# Altium schematic sheet A3x4.SchDoc: Название платы
size 1188 x 420 mm; ApprovedBy: Рогов; CheckedBy: Фамилия проверяющего; DrawnBy: Фамилия разработчика; DocumentNumber: Введите номер платы + Э3; SheetNumber: пусто если листов 1, иначе 1; SheetTotal: количество листов; Format: A3x4; DocumentType: тип схемы; Title1str: вторая строка при необходимости; ImagePath: Введите номер платы
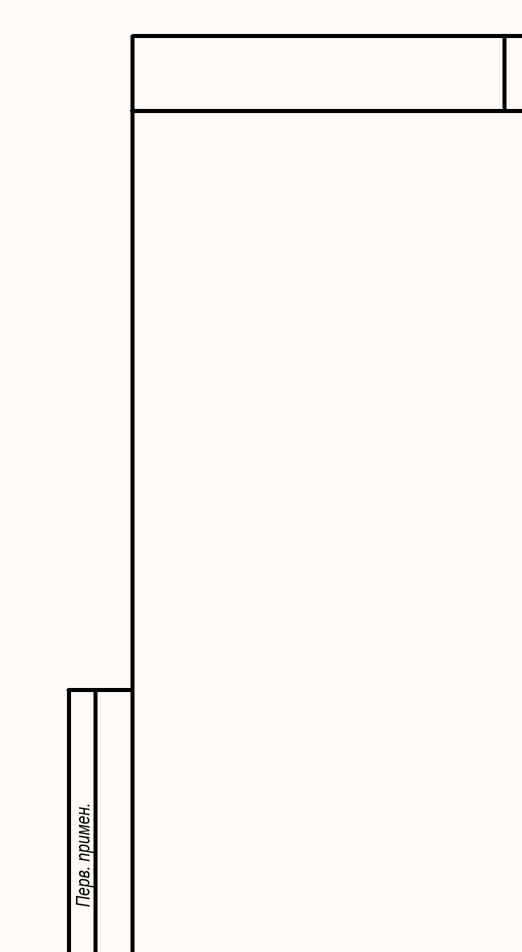
[diagram p0: A3x4.SchDoc, top column 1 of 4]
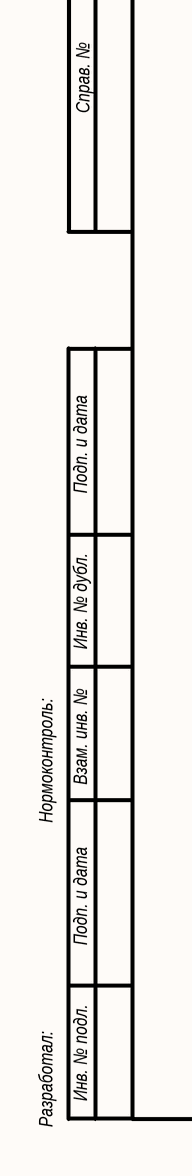
[diagram p1: A3x4.SchDoc, bottom column 1 of 4]
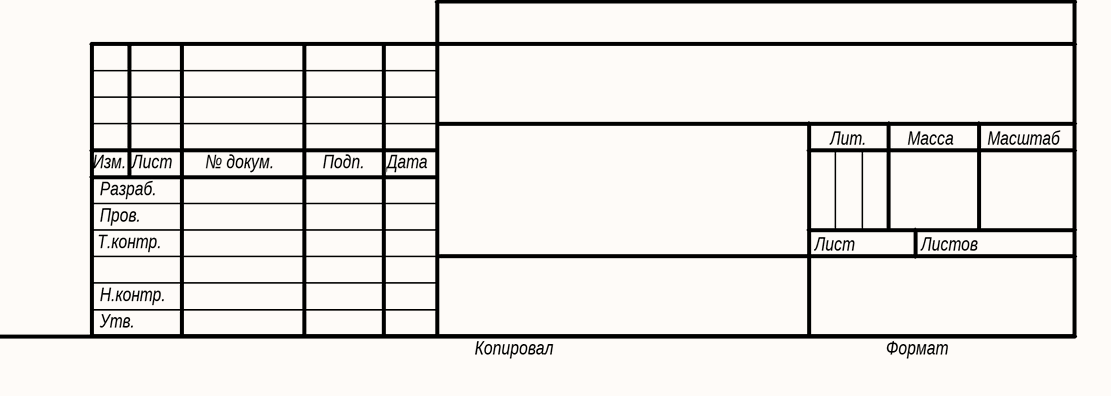
[diagram p2: A3x4.SchDoc, bottom column 4 of 4]

## Notes on the sheet
- Перв. примен.
- Справ. №
- Подп. и дата
- Инв. № дубл.
- Нормоконтроль:
- Взам. инв. №
- Изм.
- Лист
- № докум.
- Подп.
- Дата
- Лит.
- Масса
- Масштаб
- Т.контр.
- Пров.
- Разраб.
- Листов
- Разработал:
- Инв. № подл.
- Н.контр.
- Утв.
- Копировал
- Формат